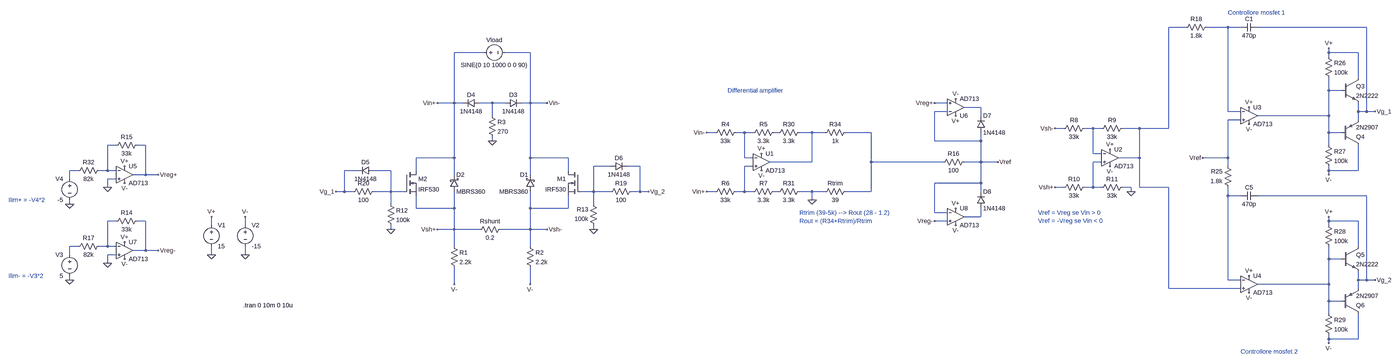
[diagram p0: schematic Electronic load.asc, whole sheet]
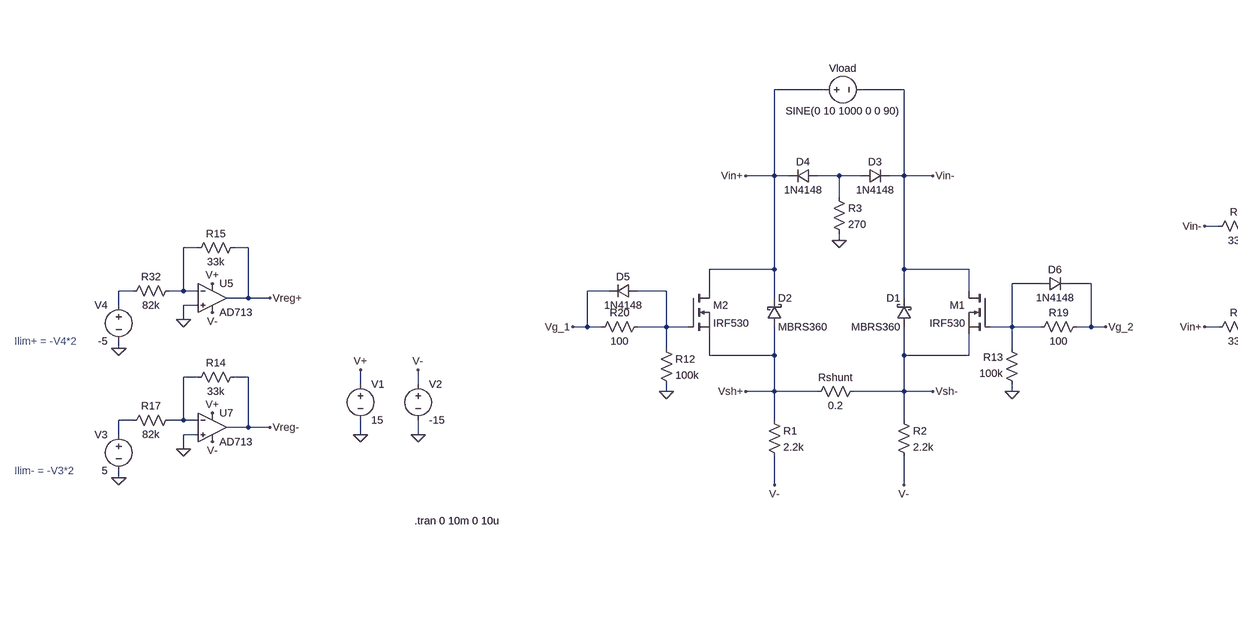
[diagram p1: schematic Electronic load.asc, part, row 1 of 1, column 1 of 2]
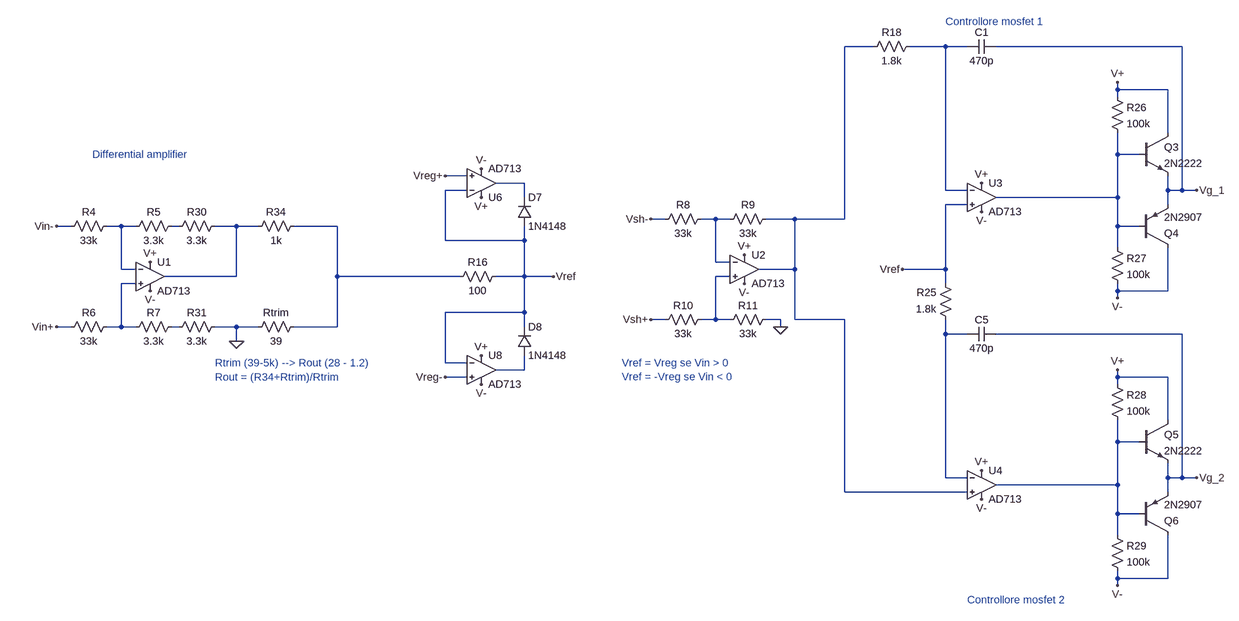
[diagram p2: schematic Electronic load.asc, part, row 1 of 1, column 2 of 2]
Electronic load.asc, the LTspice schematic file:
Version 4
SHEET 1 4616 896
WIRE 2624 -592 2560 -592
WIRE 2784 -592 2704 -592
WIRE 2832 -592 2784 -592
WIRE 3440 -592 2896 -592
WIRE -144 -496 -256 -496
WIRE 32 -496 -64 -496
WIRE 3296 -496 3296 -512
WIRE 3408 -496 3296 -496
WIRE 3296 -480 3296 -496
WIRE 3408 -400 3408 -496
WIRE 3296 -352 3296 -400
WIRE 3344 -352 3296 -352
WIRE -256 -304 -256 -496
WIRE -256 -304 -320 -304
WIRE -224 -304 -256 -304
WIRE -112 -304 -160 -304
WIRE -64 -304 -112 -304
WIRE 32 -304 32 -496
WIRE 32 -304 0 -304
WIRE 96 -304 32 -304
WIRE 1632 -304 1584 -304
WIRE 1760 -288 1696 -288
WIRE 1632 -272 1584 -272
WIRE 2784 -272 2784 -592
WIRE 2832 -272 2784 -272
WIRE 3408 -272 3408 -304
WIRE 3440 -272 3440 -592
WIRE 3440 -272 3408 -272
WIRE 3472 -272 3440 -272
WIRE -112 -256 -112 -304
WIRE 1760 -256 1760 -288
WIRE 3296 -256 3296 -352
WIRE 3296 -256 2896 -256
WIRE 2832 -240 2784 -240
WIRE 3408 -240 3408 -272
WIRE 2096 -208 2064 -208
WIRE 2208 -208 2176 -208
WIRE 2240 -208 2208 -208
WIRE 2384 -208 2320 -208
WIRE 2560 -208 2560 -592
WIRE 2560 -208 2384 -208
WIRE 752 -192 720 -192
WIRE 864 -192 832 -192
WIRE 896 -192 864 -192
WIRE 992 -192 976 -192
WIRE 1120 -192 1072 -192
WIRE 1168 -192 1120 -192
WIRE 1344 -192 1248 -192
WIRE 3296 -192 3296 -256
WIRE 3344 -192 3296 -192
WIRE -112 -160 -112 -176
WIRE 1584 -160 1584 -272
WIRE 1760 -160 1760 -192
WIRE 1760 -160 1584 -160
WIRE -1664 -144 -1696 -144
WIRE -1552 -144 -1584 -144
WIRE 3296 -144 3296 -192
WIRE 2208 -112 2208 -208
WIRE 2240 -112 2208 -112
WIRE -256 -96 -256 -304
WIRE -256 -96 -400 -96
WIRE 32 -96 32 -304
WIRE 176 -96 32 -96
WIRE 864 -96 864 -192
WIRE 896 -96 864 -96
WIRE 2384 -96 2384 -208
WIRE 2384 -96 2304 -96
WIRE 2784 -96 2784 -240
WIRE 2784 -96 2688 -96
WIRE 1120 -80 1120 -192
WIRE 1120 -80 960 -80
WIRE 1344 -80 1344 -192
WIRE 1616 -80 1344 -80
WIRE 1760 -80 1760 -160
WIRE 1760 -80 1696 -80
WIRE 1824 -80 1760 -80
WIRE 2240 -80 2208 -80
WIRE 336 -64 272 -64
WIRE 448 -64 400 -64
WIRE 896 -64 864 -64
WIRE 2784 -64 2784 -96
WIRE -1808 -48 -1840 -48
WIRE -1696 -48 -1696 -144
WIRE -1696 -48 -1728 -48
WIRE -1664 -48 -1696 -48
WIRE -624 -48 -672 -48
WIRE -496 -48 -560 -48
WIRE -400 -48 -400 -96
WIRE 176 -48 176 -96
WIRE 3296 -48 3296 -64
WIRE 3408 -48 3408 -144
WIRE 3408 -48 3296 -48
WIRE -1552 -32 -1552 -144
WIRE -1552 -32 -1600 -32
WIRE -1504 -32 -1552 -32
WIRE -256 -32 -256 -96
WIRE 32 -32 32 -96
WIRE 3296 -32 3296 -48
WIRE -1840 -16 -1840 -48
WIRE -1664 -16 -1696 -16
WIRE 1760 0 1760 -80
WIRE 1760 0 1584 0
WIRE -1696 16 -1696 -16
WIRE 2096 16 2064 16
WIRE 2208 16 2208 -80
WIRE 2208 16 2176 16
WIRE 2240 16 2208 16
WIRE 2352 16 2320 16
WIRE 2384 16 2384 -96
WIRE 2560 16 2384 16
WIRE -672 32 -672 -48
WIRE -672 32 -704 32
WIRE -640 32 -672 32
WIRE -496 32 -496 -48
WIRE -496 32 -560 32
WIRE -448 32 -496 32
WIRE 272 32 272 -64
WIRE 272 32 224 32
WIRE 336 32 272 32
WIRE 448 32 448 -64
WIRE 448 32 416 32
WIRE 480 32 448 32
WIRE 752 32 720 32
WIRE 864 32 864 -64
WIRE 864 32 832 32
WIRE 896 32 864 32
WIRE 992 32 976 32
WIRE 1120 32 1072 32
WIRE 1168 32 1120 32
WIRE 1344 32 1344 -80
WIRE 1344 32 1248 32
WIRE 1760 32 1760 0
WIRE 2352 32 2352 16
WIRE 2784 48 2784 16
WIRE 2832 48 2784 48
WIRE 3440 48 2896 48
WIRE 1120 64 1120 32
WIRE -1840 80 -1840 64
WIRE -496 80 -496 32
WIRE 272 80 272 32
WIRE -400 96 -400 48
WIRE -256 96 -256 32
WIRE -256 96 -400 96
WIRE 32 96 32 32
WIRE 176 96 176 48
WIRE 176 96 32 96
WIRE 1584 112 1584 0
WIRE 1632 112 1584 112
WIRE 1760 128 1760 96
WIRE 1760 128 1696 128
WIRE -1664 144 -1696 144
WIRE -1552 144 -1584 144
WIRE 1632 144 1584 144
WIRE 3296 144 3296 128
WIRE 3408 144 3296 144
WIRE -1216 160 -1216 128
WIRE -1088 160 -1088 128
WIRE 3296 160 3296 144
WIRE -496 176 -496 160
WIRE -256 176 -256 96
WIRE -256 176 -320 176
WIRE -160 176 -256 176
WIRE 32 176 32 96
WIRE 32 176 -80 176
WIRE 96 176 32 176
WIRE 272 176 272 160
WIRE -1808 240 -1840 240
WIRE -1696 240 -1696 144
WIRE -1696 240 -1728 240
WIRE -1664 240 -1696 240
WIRE -256 240 -256 176
WIRE 32 240 32 176
WIRE 3408 240 3408 144
WIRE -1552 256 -1552 144
WIRE -1552 256 -1600 256
WIRE -1504 256 -1552 256
WIRE -1840 272 -1840 240
WIRE -1664 272 -1696 272
WIRE -1216 272 -1216 240
WIRE -1088 272 -1088 240
WIRE 3296 288 3296 240
WIRE 3344 288 3296 288
WIRE -1696 304 -1696 272
WIRE -1840 368 -1840 352
WIRE 2784 368 2784 48
WIRE 2832 368 2784 368
WIRE 3408 368 3408 336
WIRE 3440 368 3440 48
WIRE 3440 368 3408 368
WIRE 3472 368 3440 368
WIRE -256 384 -256 320
WIRE 32 384 32 320
WIRE 3296 384 3296 288
WIRE 3296 384 2896 384
WIRE 2560 400 2560 16
WIRE 2832 400 2560 400
WIRE 3408 400 3408 368
WIRE 3296 448 3296 384
WIRE 3344 448 3296 448
WIRE 3296 496 3296 448
WIRE 3296 592 3296 576
WIRE 3408 592 3408 496
WIRE 3408 592 3296 592
WIRE 3296 608 3296 592
FLAG -1088 272 0
FLAG -1216 272 0
FLAG -1216 128 V+
FLAG -1088 128 V-
FLAG -256 384 V-
FLAG 32 384 V-
FLAG -112 -160 0
FLAG 928 -48 V-
FLAG 928 -112 V+
FLAG 1120 64 0
FLAG 2272 -64 V-
FLAG 2272 -128 V+
FLAG 2352 32 0
FLAG -320 -304 Vin+
FLAG 96 -304 Vin-
FLAG -320 176 Vsh+
FLAG 96 176 Vsh-
FLAG 720 32 Vin+
FLAG 720 -192 Vin-
FLAG 2064 16 Vsh+
FLAG 2064 -208 Vsh-
FLAG 480 32 Vg_2
FLAG 2864 -224 V-
FLAG 2864 -288 V+
FLAG 3472 -272 Vg_1
FLAG -704 32 Vg_1
FLAG 1664 -320 V-
FLAG 1664 -256 V+
FLAG 1824 -80 Vref
FLAG 2688 -96 Vref
FLAG -496 176 0
FLAG 272 176 0
FLAG 3296 -512 V+
FLAG 3296 -32 V-
FLAG 2864 416 V-
FLAG 2864 352 V+
FLAG 3296 128 V+
FLAG 3296 608 V-
FLAG 3472 368 Vg_2
FLAG -1632 0 V-
FLAG -1632 -64 V+
FLAG -1504 -32 Vreg+
FLAG -1840 80 0
FLAG 1664 160 V-
FLAG 1664 96 V+
FLAG 1584 -304 Vreg+
FLAG 1584 144 Vreg-
FLAG -1696 16 0
FLAG -1632 288 V-
FLAG -1632 224 V+
FLAG -1504 256 Vreg-
FLAG -1840 368 0
FLAG -1696 304 0
SYMBOL voltage -1216 144 R0
SYMATTR InstName V1
SYMATTR Value 15
SYMBOL voltage -1088 144 R0
SYMATTR InstName V2
SYMATTR Value -15
SYMBOL nmos 224 -48 M0
SYMATTR InstName M1
SYMATTR Value IRF530
SYMBOL nmos -448 -48 R0
SYMATTR InstName M2
SYMATTR Value IRF530
SYMBOL schottky -272 32 M180
WINDOW 0 24 64 Left 2
WINDOW 3 24 0 Left 2
SYMATTR InstName D2
SYMATTR Value MBRS360
SYMATTR Description Diode
SYMATTR Type diode
SYMBOL res -176 192 R270
WINDOW 0 32 56 VTop 2
WINDOW 3 0 56 VBottom 2
SYMATTR InstName Rshunt
SYMATTR Value 0.2
SYMBOL res -272 224 R0
SYMATTR InstName R1
SYMATTR Value 2.2k
SYMBOL res 16 224 R0
SYMATTR InstName R2
SYMATTR Value 2.2k
SYMBOL diode -64 -320 M90
WINDOW 0 0 32 VBottom 2
WINDOW 3 32 32 VTop 2
SYMATTR InstName D3
SYMATTR Value 1N4148
SYMBOL diode -160 -288 M270
WINDOW 0 32 32 VTop 2
WINDOW 3 0 32 VBottom 2
SYMATTR InstName D4
SYMATTR Value 1N4148
SYMBOL res -128 -272 R0
SYMATTR InstName R3
SYMATTR Value 270
SYMBOL schottky 48 32 R180
WINDOW 0 24 64 Left 2
WINDOW 3 24 0 Left 2
SYMATTR InstName D1
SYMATTR Value MBRS360
SYMATTR Description Diode
SYMATTR Type diode
SYMBOL OpAmps\\AD713 928 -144 R0
SYMATTR InstName U1
SYMBOL res 848 -208 R90
WINDOW 0 0 56 VBottom 2
WINDOW 3 32 56 VTop 2
SYMATTR InstName R4
SYMATTR Value 33k
SYMBOL res 992 -208 R90
WINDOW 0 0 56 VBottom 2
WINDOW 3 32 56 VTop 2
SYMATTR InstName R5
SYMATTR Value 3.3k
SYMBOL res 848 16 R90
WINDOW 0 0 56 VBottom 2
WINDOW 3 32 56 VTop 2
SYMATTR InstName R6
SYMATTR Value 33k
SYMBOL res 992 16 R90
WINDOW 0 0 56 VBottom 2
WINDOW 3 32 56 VTop 2
SYMATTR InstName R7
SYMATTR Value 3.3k
SYMBOL OpAmps\\AD713 2272 -160 R0
SYMATTR InstName U2
SYMBOL res 2192 -224 R90
WINDOW 0 0 56 VBottom 2
WINDOW 3 32 56 VTop 2
SYMATTR InstName R8
SYMATTR Value 33k
SYMBOL res 2336 -224 R90
WINDOW 0 0 56 VBottom 2
WINDOW 3 32 56 VTop 2
SYMATTR InstName R9
SYMATTR Value 33k
SYMBOL res 2192 0 R90
WINDOW 0 0 56 VBottom 2
WINDOW 3 32 56 VTop 2
SYMATTR InstName R10
SYMATTR Value 33k
SYMBOL res 2336 0 R90
WINDOW 0 0 56 VBottom 2
WINDOW 3 32 56 VTop 2
SYMATTR InstName R11
SYMATTR Value 33k
SYMBOL voltage -160 -496 M90
WINDOW 0 -32 56 VBottom 2
WINDOW 3 32 56 VTop 2
WINDOW 123 0 0 Left 0
WINDOW 39 0 0 Left 0
SYMATTR InstName Vload
SYMATTR Value SINE(0 10 1000 0 0 90)
SYMBOL OpAmps\\AD713 2864 -320 R0
SYMATTR InstName U3
SYMBOL res 432 16 R90
WINDOW 0 0 56 VBottom 2
WINDOW 3 32 56 VTop 2
SYMATTR InstName R19
SYMATTR Value 100
SYMBOL res -656 48 R270
WINDOW 0 32 56 VTop 2
WINDOW 3 0 56 VBottom 2
SYMATTR InstName R20
SYMATTR Value 100
SYMBOL cap 2896 -608 R90
WINDOW 0 0 32 VBottom 2
WINDOW 3 32 32 VTop 2
SYMATTR InstName C1
SYMATTR Value 470p
SYMBOL res 2720 -608 R90
WINDOW 0 0 56 VBottom 2
WINDOW 3 32 56 VTop 2
SYMATTR InstName R18
SYMATTR Value 1.8k
SYMBOL OpAmps\\AD713 1664 -224 M180
SYMATTR InstName U6
SYMBOL res -512 64 R0
SYMATTR InstName R12
SYMATTR Value 100k
SYMBOL res 288 176 R180
WINDOW 0 36 76 Left 2
WINDOW 3 36 40 Left 2
SYMATTR InstName R13
SYMATTR Value 100k
SYMBOL diode -560 -32 M270
WINDOW 0 32 32 VTop 2
WINDOW 3 0 32 VBottom 2
SYMATTR InstName D5
SYMATTR Value 1N4148
SYMBOL diode 336 -80 M90
WINDOW 0 0 32 VBottom 2
WINDOW 3 32 32 VTop 2
SYMATTR InstName D6
SYMATTR Value 1N4148
SYMBOL npn 3344 -400 R0
SYMATTR InstName Q3
SYMATTR Value 2N2222
SYMBOL pnp 3344 -144 M180
SYMATTR InstName Q4
SYMATTR Value 2N2907
SYMBOL res 3280 -496 R0
SYMATTR InstName R26
SYMATTR Value 100k
SYMBOL res 3280 -160 R0
SYMATTR InstName R27
SYMATTR Value 100k
SYMBOL OpAmps\\AD713 2864 320 R0
SYMATTR InstName U4
SYMBOL cap 2896 32 R90
WINDOW 0 0 32 VBottom 2
WINDOW 3 32 32 VTop 2
SYMATTR InstName C5
SYMATTR Value 470p
SYMBOL res 2800 32 R180
WINDOW 0 36 76 Left 2
WINDOW 3 36 40 Left 2
SYMATTR InstName R25
SYMATTR Value 1.8k
SYMBOL npn 3344 240 R0
SYMATTR InstName Q5
SYMATTR Value 2N2222
SYMBOL pnp 3344 496 M180
SYMATTR InstName Q6
SYMATTR Value 2N2907
SYMBOL res 3280 144 R0
SYMATTR InstName R28
SYMATTR Value 100k
SYMBOL res 3280 480 R0
SYMATTR InstName R29
SYMATTR Value 100k
SYMBOL res 1088 -208 R90
WINDOW 0 0 56 VBottom 2
WINDOW 3 32 56 VTop 2
SYMATTR InstName R30
SYMATTR Value 3.3k
SYMBOL res 1088 16 R90
WINDOW 0 0 56 VBottom 2
WINDOW 3 32 56 VTop 2
SYMATTR InstName R31
SYMATTR Value 3.3k
SYMBOL OpAmps\\AD713 -1632 -96 R0
SYMATTR InstName U5
SYMBOL res -1568 -160 R90
WINDOW 0 0 56 VBottom 2
WINDOW 3 32 56 VTop 2
SYMATTR InstName R15
SYMATTR Value 33k
SYMBOL voltage -1840 -32 M0
WINDOW 123 0 0 Left 0
WINDOW 39 0 0 Left 0
SYMATTR InstName V4
SYMATTR Value -5
SYMBOL res -1824 -32 R270
WINDOW 0 32 56 VTop 2
WINDOW 3 0 56 VBottom 2
SYMATTR InstName R32
SYMATTR Value 82k
SYMBOL diode 1744 -192 M180
WINDOW 0 24 64 Left 2
WINDOW 3 24 0 Left 2
SYMATTR InstName D7
SYMATTR Value 1N4148
SYMBOL OpAmps\\AD713 1664 64 R0
SYMATTR InstName U8
SYMBOL diode 1744 96 M180
WINDOW 0 24 64 Left 2
WINDOW 3 24 0 Left 2
SYMATTR InstName D8
SYMATTR Value 1N4148
SYMBOL res 1712 -96 R90
WINDOW 0 0 56 VBottom 2
WINDOW 3 32 56 VTop 2
SYMATTR InstName R16
SYMATTR Value 100
SYMBOL res 1264 -208 R90
WINDOW 0 0 56 VBottom 2
WINDOW 3 32 56 VTop 2
SYMATTR InstName R34
SYMATTR Value 1k
SYMBOL res 1264 16 R90
WINDOW 0 0 56 VBottom 2
WINDOW 3 32 56 VTop 2
SYMATTR InstName Rtrim
SYMATTR Value 39
SYMBOL OpAmps\\AD713 -1632 192 R0
SYMATTR InstName U7
SYMBOL res -1568 128 R90
WINDOW 0 0 56 VBottom 2
WINDOW 3 32 56 VTop 2
SYMATTR InstName R14
SYMATTR Value 33k
SYMBOL voltage -1840 256 M0
WINDOW 123 0 0 Left 0
WINDOW 39 0 0 Left 0
SYMATTR InstName V3
SYMATTR Value 5
SYMBOL res -1824 256 R270
WINDOW 0 32 56 VTop 2
WINDOW 3 0 56 VBottom 2
SYMATTR InstName R17
SYMATTR Value 82k
TEXT -1096 464 Left 2 !.tran 0 10m 0 10u
TEXT 2000 112 Left 2 ;Vref = Vreg se Vin > 0\nVref = -Vreg se Vin < 0
TEXT 800 -352 Left 2 ;Differential amplifier
TEXT 2784 -648 Left 2 ;Controllore mosfet 1
TEXT 2832 640 Left 2 ;Controllore mosfet 2
TEXT 1072 112 Left 2 ;Rtrim (39-5k) --> Rout (28 - 1.2)
TEXT 1072 144 Left 2 ;Rout = (R34+Rtrim)/Rtrim
TEXT -2072 64 Left 2 ;Ilim+ = -V4*2
TEXT -2072 352 Left 2 ;Ilim- = -V3*2

The netlist it stands for:
* Electronic load.asc
V1 V+ 0 15
V2 V- 0 -15
M1 Vin- N013 Vsh- Vsh- IRF530
M2 Vin+ N016 Vsh+ Vsh+ IRF530
D2 Vsh+ Vin+ MBRS360
Rshunt Vsh+ Vsh- 0.2
R1 Vsh+ V- 2.2k
R2 Vsh- V- 2.2k
D3 N004 Vin- 1N4148
D4 N004 Vin+ 1N4148
R3 N004 0 270
D1 Vsh- Vin- MBRS360
XU1 N014 N007 V+ V- N009 AD712  ; AD713, pins In+ In- V+ V- OUT
R4 N007 Vin- 33k
R5 N008 N007 3.3k
R6 N014 Vin+ 33k
R7 N017 N014 3.3k
XU2 N012 N006 V+ V- N001 AD712  ; AD713, pins In+ In- V+ V- OUT
R8 N006 Vsh- 33k
R9 N001 N006 33k
R10 N012 Vsh+ 33k
R11 0 N012 33k
Vload Vin+ Vin- SINE(0 10 1000 0 0 90)
XU3 Vref N002 V+ V- N003 AD712  ; AD713, pins In+ In- V+ V- OUT
R19 Vg_2 N013 100
R20 Vg_1 N016 100
C1 Vg_1 N002 470p
R18 N002 N001 1.8k
XU6 Vreg+ Vref V+ V- N005 AD712  ; AD713, pins In+ In- V+ V- OUT
R12 N016 0 100k
R13 0 N013 100k
D5 N016 Vg_1 1N4148
D6 N013 Vg_2 1N4148
Q3 V+ N003 Vg_1 0 2N2222
Q4 V- N003 Vg_1 0 2N2907
R26 V+ N003 100k
R27 N003 V- 100k
XU4 N001 N018 V+ V- N022 AD712  ; AD713, pins In+ In- V+ V- OUT
C5 Vg_2 N018 470p
R25 N018 Vref 1.8k
Q5 V+ N022 Vg_2 0 2N2222
Q6 V- N022 Vg_2 0 2N2907
R28 V+ N022 100k
R29 N022 V- 100k
R30 N009 N008 3.3k
R31 0 N017 3.3k
XU5 0 N011 V+ V- Vreg+ AD712  ; AD713, pins In+ In- V+ V- OUT
R15 Vreg+ N011 33k
V4 N015 0 -5
R32 N015 N011 82k
D7 Vref N005 1N4148
XU8 Vreg- Vref V+ V- N019 AD712  ; AD713, pins In+ In- V+ V- OUT
D8 N019 Vref 1N4148
R16 Vref N010 100
R34 N010 N009 1k
Rtrim N010 0 39
XU7 0 N020 V+ V- Vreg- AD712  ; AD713, pins In+ In- V+ V- OUT
R14 Vreg- N020 33k
V3 N021 0 5
R17 N021 N020 82k
.model D D
.lib standard.dio
.model NPN NPN
.model PNP PNP
.lib standard.bjt
.model NMOS NMOS
.model PMOS PMOS
.lib standard.mos
.tran 0 10m 0 10u
* Vref = Vreg se Vin > 0
* Vref = -Vreg se Vin < 0
* Differential amplifier
* Controllore mosfet 1
* Controllore mosfet 2
* Rtrim (39-5k) --> Rout (28 - 1.2)
* Rout = (R34+Rtrim)/Rtrim
* Ilim+ = -V4*2
* Ilim- = -V3*2
.lib ADI1.lib
.backanno
.end